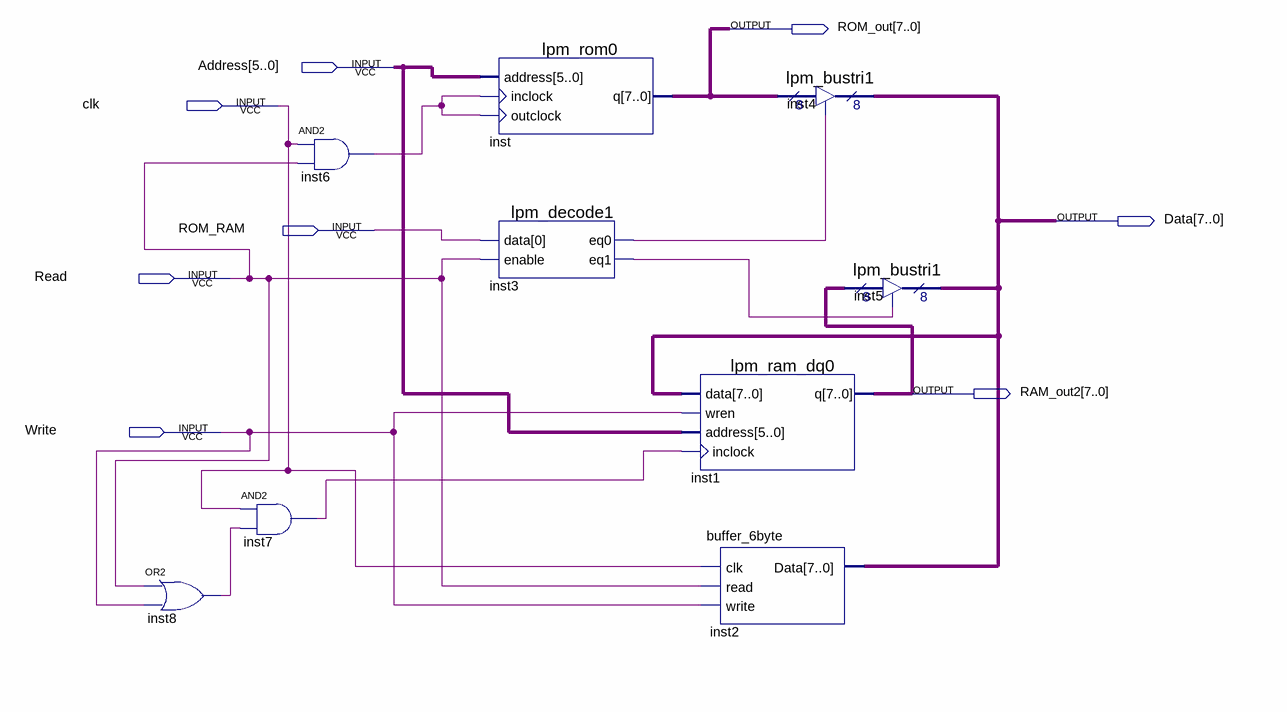
[diagram p0: schematic sheet]
// Quartus schematic Block1.bdf as structural Verilog: 9 symbols, 8 pins
module Block1 (
  input  [5:0] Address,
  input  clk,
  input  ROM_RAM,
  input  Read,
  input  Write,
  output [7:0] ROM_out,
  output [7:0] Data,
  output [7:0] RAM_out2
);

  wire inst3_eq0, inst3_eq1, inst6_out, inst7_out, inst8_out;

  or inst8 (inst8_out, Read, Write);
  and inst7 (inst7_out, clk, inst8_out);
  and inst6 (inst6_out, clk, Read);
  lpm_rom0 inst (.address(Address), .inclock(inst6_out), .outclock(inst6_out), .q(ROM_out));
  lpm_decode1 inst3 (.data(ROM_RAM), .enable(Read), .eq0(inst3_eq0), .eq1(inst3_eq1));
  lpm_ram_dq0 inst1 (.data(Data), .wren(Write), .address(Address), .inclock(inst7_out), .q(RAM_out2));
  buffer_6byte inst2 (.clk(clk), .read(Read), .write(Write), .Data(Data));
  lpm_bustri1 inst4 (.enabledt(inst3_eq0), .data(ROM_out), .tridata(Data));
  lpm_bustri1 inst5 (.enabledt(inst3_eq1), .data(RAM_out2), .tridata(Data));
endmodule
